# Altium project Industrial_Gateway_Academic.PrjPcb
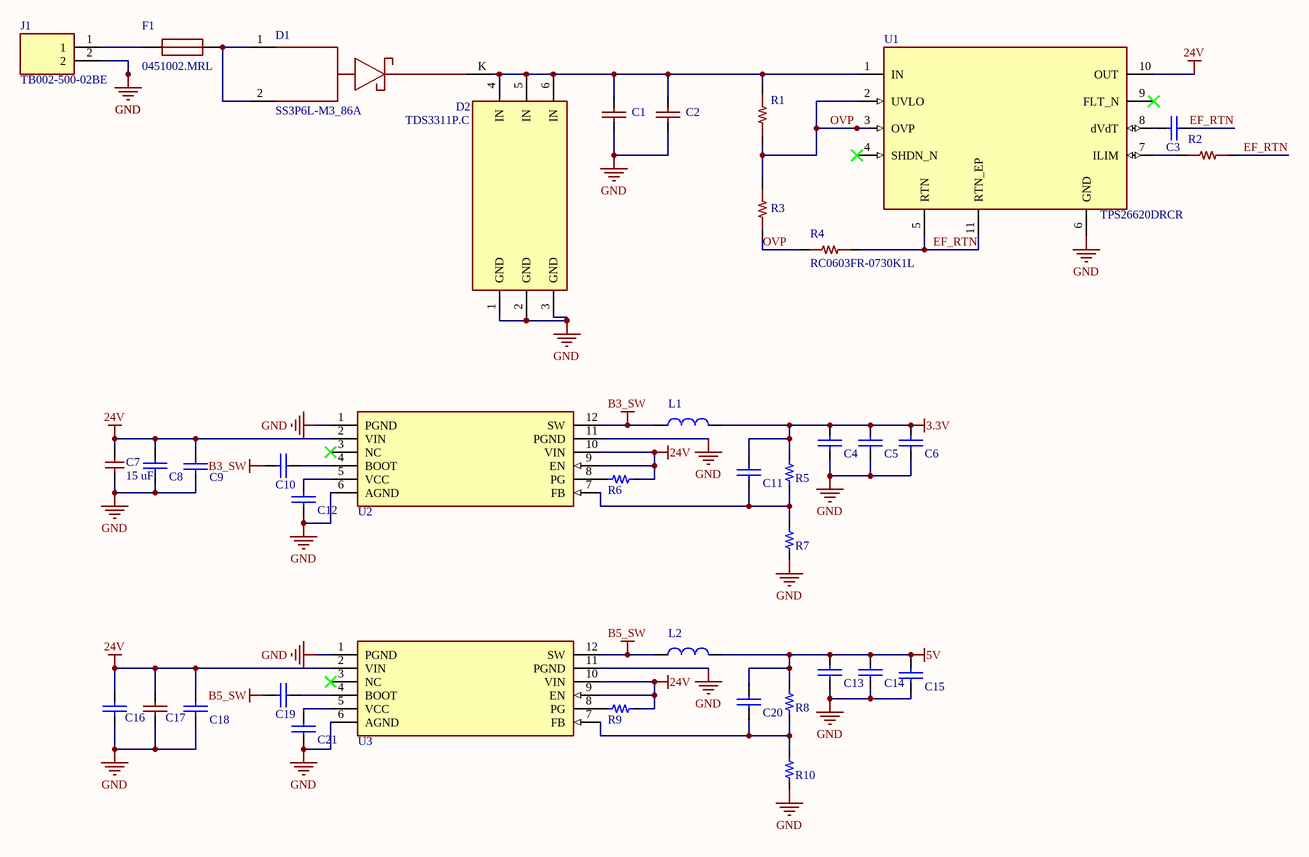
[diagram p0: Power.SchDoc]
5 sheets, 108 parts. Net scope: flat (ports and power ports of the same name join across sheets).
Board file: PCB1.PcbDoc
Sheets:
  Power.SchDoc
  MCU.SchDoc
  Ethernet.SchDoc
  TopLevel.SchDoc
  Field_IO.SchDoc

## Sheet Power.SchDoc
size A3

### Parts
C1  C0805C224K1RACTU  [GW_0805_KEMET_NOMINAL]  (value not drawn)
C2  C5750X7R2A475K230KA  [GW_C5750_TDK_REFLOW]  (value not drawn)
C3  10 nF  [GW_CAND_0603_cap]  (value not drawn)
C4  15 uF por unidad; 45 uF nominal banco  (value not drawn)
C5  15 uF por unidad; 45 uF nominal banco  (value not drawn)
C6  15 uF por unidad; 45 uF nominal banco  (value not drawn)
C7  value 15 uF  (hidden comment: CC2220X7S100V156MN)
C8  220 nF  [GW_CAND_0805_cap]  (value not drawn)
C9  220 nF  [GW_CAND_0805_cap]  (value not drawn)
C10  100 nF  [GW_CAND_0603_cap]  (value not drawn)
C11  20 pF  [GW_CAND_0603_cap]  (value not drawn)
C12  1 uF  [GW_CAND_0603_cap]  (value not drawn)
C13  15 uF por unidad; 45 uF nominal banco  (value not drawn)
C14  15 uF por unidad; 45 uF nominal banco  (value not drawn)
C15  15 uF por unidad; 45 uF nominal banco  (value not drawn)
C16  4.7 uF  [GW_CAND_0805_cap]  (value not drawn)
C17  C0805C224K1RACTU  [GW_0805_KEMET_NOMINAL]  (value not drawn)
C18  220 nF  [GW_CAND_0805_cap]  (value not drawn)
C19  100 nF  [GW_CAND_0603_cap]  (value not drawn)
C20  20 pF  [GW_CAND_0603_cap]  (value not drawn)
C21  1 uF  [GW_CAND_0603_cap]  (value not drawn)
D1  SS3P6L-M3_86A  [GW_SS3P6L_VISHAY_88987]
D2  TDS3311P.C  [GW_TDS3311P_SEMTECH]
F1  0451002.MRL
J1  TB002-500-02BE  [CUI_TB002-500-02BE]
L1  6.8 uH  (value not drawn)
L2  10 uH  (value not drawn)
R1  RC0603FR-07768KL  [GW_RC0603_YAGEO_REFLOW]  (value not drawn)
R2  RC0603FR-0713K3L  [GW_RC0603_YAGEO_REFLOW]  (value not drawn)
R3  RC0603FR-0733K2L  [GW_RC0603_YAGEO_REFLOW]  (value not drawn)
R4  RC0603FR-0730K1L  [GW_RC0603_YAGEO_REFLOW]
R5  100 kOhm  [GW_CAND_0603_res]  (value not drawn)
R6  100 kOhm  [GW_CAND_0603_res]  (value not drawn)
R7  43.2 kOhm  [GW_CAND_0603_res]  (value not drawn)
R8  100 kOhm  [GW_CAND_0603_res]  (value not drawn)
R9  100 kOhm  [GW_CAND_0603_res]  (value not drawn)
R10  24.9 kOhm  [GW_CAND_0603_res]  (value not drawn)
U1  TPS26620DRCR  [GW_DRC0010J_TI_TPS2662]
U2  LMR36015FBRNXR  [GW_RNX0012A_TI]  (value not drawn)
U3  LMR36015FBRNXR  [GW_RNX0012A_TI]  (value not drawn)

### Nets
3.3V: C4.1 C5.1 C6.1 C11.1 L1.2 R5.2
5V: C13.1 C14.1 C15.1 C20.1 L2.2 R8.2
24V: C7.2 C8.1 C9.1 C16.1 C17.2 C18.1 R6.1 R9.1 U1.10(OUT) U2.2(VIN) U2.9(EN) U2.10(VIN) U3.2(VIN) U3.9(EN) U3.10(VIN)
B3_SW: C10.1 L1.1 U2.12(SW)
B5_SW: C19.1 L2.1 U3.12(SW)
GND: C1.1 C2.1 C4.2 C5.2 C6.2 C7.1 C8.2 C9.2 C12.2 C13.2 C14.2 C15.2 C16.2 C17.1 C18.2 C21.2 D2.1(GND) D2.2(GND) D2.3(GND) J1.2 R7.1 R10.1 U1.6(GND) U2.1(PGND) U2.6(AGND) U2.11(PGND) U3.1(PGND) U3.6(AGND) U3.11(PGND)
EF_RTN: C3.1 R2.2 R4.2 U1.5(RTN) U1.11(RTN_EP)
OVP: R1.1 R3.1 R3.2 R4.1 U1.2(UVLO) U1.3(OVP)
NetC1_2: C1.2 C2.2 D1.K(CATHODE) D2.4(IN) D2.5(IN) D2.6(IN) R1.2 U1.1(IN)
NetC3_2: C3.2 U1.8(dVdT)
NetC10_2: C10.2 U2.4(BOOT)
NetC11_2: C11.2 R5.1 R7.2 U2.7(FB)
NetC12_1: C12.1 U2.5(VCC)
NetC19_2: C19.2 U3.4(BOOT)
NetC20_2: C20.2 R8.1 R10.2 U3.7(FB)
NetC21_1: C21.1 U3.5(VCC)
NetD1_1: D1.1(ANODE1) D1.2(ANODE2) F1.2(END2)
NetF1_1: F1.1(END1) J1.1
NetR2_1: R2.1 U1.7(ILIM)
NetR6_2: R6.2 U2.8(PG)
NetR9_2: R9.2 U3.8(PG)

Not connected (* = marked no-connect by the designer): U1 4(SHDN_N)* 9(FLT_N)*; U2 3(NC)*; U3 3(NC)*

### Library data of the parts
C1 C17 = C0805C224K1RACTU: KEMET exact0805 spec body/termination dimensions; KEMET C1027 p12 Table3 nominal2012 reflow lands transferred to mechanically matching commercial0805; 220nF10%100VX7R;; Design Approval: PROTOTYPE_APPROVED; Electrical Test: NOT_TESTED; CAD Status: CAD_VERIFIED; Limitations: None; Manufacturer: KEMET; Manufacturer Part Number: C0805C224K1RACTU; Value: 220nF10%100VX7R; Source: KEMET exact0805 spec body/termination dimensions; KEMET C1027 p12 Table3 nominal2012 reflow lands transferred to mechanically matching commercial0805
C2 = C5750X7R2A475K230KA: TDK C5750X7R2A475K230KA exact2014web-derived PDF p1 lands,p2 DCbias; current official product page same PA/PB/PC; 4.7uF10%100VX7R;; Design Approval: PROTOTYPE_APPROVED; Electrical Test: NOT_TESTED; CAD Status: CAD_VERIFIED; Limitations: None; Manufacturer: TDK; Manufacturer Part Number: C5750X7R2A475K230KA; Value: 4.7uF10%100VX7R; Source: TDK C5750X7R2A475K230KA exact2014web-derived PDF p1 lands,p2 DCbias; current official product page same PA/PB/PC
C3 = GW_C0603C103K1RACTU_97f3ee33: C0603C103K1RACTU; 10 nF; 100 V; X7R; -55..125 C; CAD_CANDIDATE; Manufacturer: KEMET; Tolerance: 10%; Electrical_Status: PROVISIONAL; CAD_Source: Professor_shared.SchLib glyph Cap_0.1uF_0603_50V; CAD_Limitations: Glyph pins/types inspected; exact manufacturer land-pattern/mask/paste qualification pending.; Electrical_Notes: Ficha KEMET local DI_CIN p1; no confundir con externo CL10B103KA8WPNC 25 V. Modelo candidato existente; sin cotejo visual de pads/pines en Altium.; Manufacturer Part Number: C0603C103K1RACTU; Value: 10 nF; Rating: 100 V; X7R; -55..125 C; Power Rating: N/A; Package: 0603; CAD_Status: CAD_CANDIDATE
C4-C6 C13-C15 = GW_C3225X7R1C156M250AB_bb412b42: C3225X7R1C156M250AB; 15 uF por unidad; 45 uF nominal banco; 16 V; X7R; CAD_CANDIDATE; Manufacturer: TDK; Tolerance: 20%; CAD_Status: CAD_BLOCKED; Electrical_Status: PROVISIONAL; CAD_Source: Professor_shared.SchLib glyph Cap_0.1uF_0603_50V; CAD_Limitations: Symbol only. Exact manufacturer land pattern absent locally; footprint blocked. Ratings copied from provisional BOM, not newly approved.; Electrical_Notes: Ceff a 3.3 V, ESR, escalon de carga y Bode pendientes. No atribuir 45 uF efectivos ni ESR3.04mOhm del modelo AR. Sin footprint1210 docente.; Manufacturer Part Number: C3225X7R1C156M250AB; Value: 15 uF por unidad; 45 uF nominal banco; Rating: 16 V; X7R; Power Rating: N/A; Package: 1210
C7 = CC2220X7S100V156MN: TORCH15uF100V2220 MLCC; C54157533 catalog identity; family PDF does not explicitly cover X7S. Footprint pending exact manufacturer lands.; Manufacturer: TORCH; Tolerance: 20% (M ordering code); Voltage Rating: 100 V; Dielectric: X7S per MPN; not explicitly covered in supplied family PDF; CAD Status: SYMBOL_READY;FOOTPRINT_MISSING; Electrical Status: PROVISIONAL;NOT_SELECTED_AS_BOM_REPLACEMENT; Limitations: Family PDF p1 codes156/M/100V and2220body; X7S exact specifications, DCbias/effective capacitance and manufacturer lands unverified. No application approval.; Manufacturer Part Number: CC2220X7S100V156MN; Package: 2220; LCSC: C54157533; Datasheet: sources/cap15uf100v/C54157533.pdf; Catalog URL: https://www.lcsc.com/product-detail/C54157533.html
C8 C9 C18 = GW_C0805C224K1RACTU_e16e52b8: C0805C224K1RACTU; 220 nF; 100 V; X7R; CAD_CANDIDATE; Manufacturer: KEMET; Tolerance: 10%; Electrical_Status: PROVISIONAL; CAD_Source: Professor_shared.SchLib glyph Cap_10uF_0805_25V_; CAD_Limitations: Glyph pins/types inspected; exact manufacturer land-pattern/mask/paste qualification pending.; Electrical_Notes: Uno por par VIN-PGND en lados opuestos; falta Ceff y cotejo dimensiones pads. Modelo candidato existente; sin cotejo visual de pads/pines en Altium.; Manufacturer Part Number: C0805C224K1RACTU; Value: 220 nF; Rating: 100 V; X7R; Power Rating: N/A; Package: 0805; CAD_Status: CAD_CANDIDATE
C10 C19 = GW_C0603C104K5RACTU_dc5e12a5: C0603C104K5RACTU; 100 nF; 50 V; X7R; -55..125 C; CAD_CANDIDATE; Manufacturer: KEMET; Tolerance: 10%; Electrical_Status: PROVISIONAL; CAD_Source: Professor_shared.SchLib glyph Cap_0.1uF_0603_50V; CAD_Limitations: Glyph pins/types inspected; exact manufacturer land-pattern/mask/paste qualification pending.; Electrical_Notes: Ficha KEMET local p1. Adaptar parametros; no usar el Y5V 0603F104Z500CT como equivalente. Modelo candidato existente; sin cotejo visual de pads/pines en Altium.; Manufacturer Part Number: C0603C104K5RACTU; Value: 100 nF; Rating: 50 V; X7R; -55..125 C; Power Rating: N/A; Package: 0603; CAD_Status: CAD_CANDIDATE
C11 C20 = GW_C0603C200J5GACTU_c75b007a: C0603C200J5GACTU; 20 pF; 50 V; C0G; CAD_CANDIDATE; Manufacturer: KEMET; Tolerance: 5%; Electrical_Status: PROVISIONAL; CAD_Source: Professor_shared.SchLib glyph Cap_0.1uF_0603_50V; CAD_Limitations: Glyph pins/types inspected; exact manufacturer land-pattern/mask/paste qualification pending.; Electrical_Notes: Valor guia fabricante; validar lazo. Con RFBT100k no obligatorio universal; reservar DNP hasta respuesta/Bode. Modelo candidato existente; sin cotejo visual de pads/pines en Altium.; Manufacturer Part Number: C0603C200J5GACTU; Value: 20 pF; Rating: 50 V; C0G; Power Rating: N/A; Package: 0603; CAD_Status: CAD_CANDIDATE
C12 C21 = GW_CL10A105KB8NNNC_c3932faa: CL10A105KB8NNNC; 1 uF; 50 V; X5R; -55..85 C; CAD_CANDIDATE; Manufacturer: Samsung Electro-Mechanics; Tolerance: 10%; Electrical_Status: PROVISIONAL; CAD_Source: Professor_shared.SchLib glyph Cap_1uF_0603_50V; CAD_Limitations: Glyph pins/types inspected; exact manufacturer land-pattern/mask/paste qualification pending.; Electrical_Notes: Samsung ficha oficial; Ceff/ESR pendientes por aplicacion. Limite X5R 85 C: no homologado para ambiente superior. Modelo candidato existente; sin cotejo visual de pads/pines en Altium.; Manufacturer Part Number: CL10A105KB8NNNC; Value: 1 uF; Rating: 50 V; X5R; -55..85 C; Power Rating: N/A; Package: 0603; CAD_Status: CAD_CANDIDATE
C16 = GW_C0805C475K4RACTU_82374e08: C0805C475K4RACTU; 4.7 uF; 16 V; X7R; CAD_CANDIDATE; Manufacturer: KEMET; Tolerance: 10%; Electrical_Status: PROVISIONAL; CAD_Source: Professor_shared.SchLib glyph Cap_10uF_0805_25V_; CAD_Limitations: Glyph pins/types inspected; exact manufacturer land-pattern/mask/paste qualification pending.; Electrical_Notes: Ceff a 3.3 V pendiente; no sustituir por 10 uF solo por disponibilidad. Modelo candidato existente; sin cotejo visual de pads/pines en Altium.; Manufacturer Part Number: C0805C475K4RACTU; Value: 4.7 uF; Rating: 16 V; X7R; Power Rating: N/A; Package: 0805; CAD_Status: CAD_CANDIDATE
D1 = SS3P6L-M3_86A: User-approved series reverse diode:manufacturer1/2 anodes,K large cathode. Same model also reserved DNP output clamp; do not populateSOUT withoutVF review. No hot reverse while charged.; Manufacturer: Vishay; Manufacturer Part Number: SS3P6L-M3/86A; CAD Status: CAD_VERIFIED; Electrical Approval: PROTOTYPE_APPROVED; Electrical Test: NOT_TESTED; Source: Vishay88987 Rev24-Apr-2020 pp1,4; numbered anodes1/2, cathodeK; minimum mounting lands; Datasheet: sources/SS3P6L_88987.pdf; Limitations: User-approved series reverse diode:manufacturer1/2 anodes,K large cathode. Same model also reserved DNP output clamp; do not populateSOUT withoutVF review. No hot reverse while charged.; Design Approval: PROTOTYPE_APPROVED
D2 = TDS3311P.C: Semtech TDS3311P Rev2.4 pp2,7-9; official product portal confirms33V orderTDS3311P.C; 33V working;42Vmax specified35A pulse;; Design Approval: PROTOTYPE_APPROVED; Electrical Test: NOT_TESTED; CAD Status: CAD_VERIFIED; Limitations: None; Manufacturer: Semtech; Manufacturer Part Number: TDS3311P.C; Value: 33V working;42Vmax specified35A pulse; Source: Semtech TDS3311P Rev2.4 pp2,7-9; official product portal confirms33V orderTDS3311P.C
F1 = 0451002.MRL: User-approved2A125VDC fuse; manufacturer dimensioned native footprint linked. Nonpolar terminals project1/2; supervised current-limited lab source. Not electrically tested.; Manufacturer: Littelfuse; CAD Status: CAD_VERIFIED; Electrical Approval: PROTOTYPE_APPROVED; Electrical Test: NOT_TESTED; Manufacturer Part Number: 0451002.MRL; Source: Official451/453 series Rev01-Dec-2025 pp1-4; electrical row002 and ordering; Datasheet: https://www.littelfuse.com/assetdocs/fuse-451-and-453-datasheet?assetguid=533cd5cc-956c-4243-867f-6ab5a62f6ba1; Limitations: User-approved2A125VDC fuse; manufacturer dimensioned native footprint linked. Nonpolar terminals project1/2; supervised current-limited lab source. Not electrically tested.; Design Approval: PROTOTYPE_APPROVED
J1 = TB002-500-02BE: 2~24 Poles, Screw Type, Horizontal, 5.0 Pitch, 22~12 (AWG), Terminal Block Connector; Manufacturer: Same Sky (Formerly CUI Devices); MF: Same Sky; SnapEDA_Link: https://www.snapeda.com/parts/TB002-500-02BE/Same+Sky/view-part/?ref=snap; Package: None; Value: *; MP: TB002-500-02BE; Check_prices: https://www.snapeda.com/parts/TB002-500-02BE/Same+Sky/view-part/?ref=eda; Manufacturer Part Number: TB002-500-02BE
L1 = GW_XAL4030-682MEC_71dfd711: XAL4030-682MEC; 6.8 uH; Isat25C 3.6 A; Irms20C 3.0 A; CAD_CANDIDATE; Manufacturer: Coilcraft; Tolerance: 20%; CAD_Status: CAD_BLOCKED; Electrical_Status: PROVISIONAL; CAD_Source: Professor_shared.SchLib glyph Inductor_10uH_4A_7.2*6.6mm; CAD_Limitations: Symbol only. Exact manufacturer land pattern absent locally; footprint blocked. Ratings copied from provisional BOM, not newly approved.; Electrical_Notes: DCRmax25C 74.1 mOhm. Isat es caida30% tipica; falta derating caliente/curva L(I)/perdidas nucleo y CAD. No usar inductor docente sin Isat verificable.; Manufacturer Part Number: XAL4030-682MEC; Value: 6.8 uH; Rating: Isat25C 3.6 A; Irms20C 3.0 A; Power Rating: N/A; Package: XAL4030
L2 = GW_XAL4040-103MEC_b36cb917: XAL4040-103MEC; 10 uH; Isat25C 3.0 A; Irms20C 2.2 A; CAD_CANDIDATE; Manufacturer: Coilcraft; Tolerance: 20%; CAD_Status: CAD_BLOCKED; Electrical_Status: PROVISIONAL; CAD_Source: Professor_shared.SchLib glyph Inductor_10uH_4A_7.2*6.6mm; CAD_Limitations: Symbol only. Exact manufacturer land pattern absent locally; footprint blocked. Ratings copied from provisional BOM, not newly approved.; Electrical_Notes: DCRmax25C 92.4 mOhm. Isat es caida30% tipica; falta derating caliente/curva L(I)/perdidas nucleo y CAD. No usar inductor docente sin Isat verificable.; Manufacturer Part Number: XAL4040-103MEC; Value: 10 uH; Rating: Isat25C 3.0 A; Irms20C 2.2 A; Power Rating: N/A; Package: XAL4040
R1 = RC0603FR-07768KL: 768kOhm1%0.1W75V; Exact Yageo spec; manufacturer Mounting2018p4Fig4/Table1; Design Approval: PROPOSED_APPLICATION_VALUE; CAD Status: CAD_VERIFIED; Electrical Test: NOT_TESTED; Manufacturer: Yageo; Manufacturer Part Number: RC0603FR-07768KL; Value: 768kOhm1%0.1W75V; Source: Exact Yageo spec; manufacturer Mounting2018p4Fig4/Table1; Datasheet: https://yageogroup.com/download/specsheet/RC0603FR-07768KL
R2 = RC0603FR-0713K3L: 13.3kOhm1%0.1W75V; Exact Yageo spec; manufacturer Mounting2018p4Fig4/Table1; Design Approval: PROPOSED_APPLICATION_VALUE; CAD Status: CAD_VERIFIED; Electrical Test: NOT_TESTED; Manufacturer: Yageo; Manufacturer Part Number: RC0603FR-0713K3L; Value: 13.3kOhm1%0.1W75V; Source: Exact Yageo spec; manufacturer Mounting2018p4Fig4/Table1; Datasheet: https://yageogroup.com/download/specsheet/RC0603FR-0713K3L
R3 = RC0603FR-0733K2L: 33.2kOhm1%0.1W75V; Exact Yageo spec; manufacturer Mounting2018p4Fig4/Table1; Design Approval: PROPOSED_APPLICATION_VALUE; CAD Status: CAD_VERIFIED; Electrical Test: NOT_TESTED; Manufacturer: Yageo; Manufacturer Part Number: RC0603FR-0733K2L; Value: 33.2kOhm1%0.1W75V; Source: Exact Yageo spec; manufacturer Mounting2018p4Fig4/Table1; Datasheet: https://yageogroup.com/download/specsheet/RC0603FR-0733K2L
R4 = RC0603FR-0730K1L: 30.1kOhm1%0.1W75V; Exact Yageo spec; manufacturer Mounting2018p4Fig4/Table1; Design Approval: PROPOSED_APPLICATION_VALUE; CAD Status: CAD_VERIFIED; Electrical Test: NOT_TESTED; Manufacturer: Yageo; Manufacturer Part Number: RC0603FR-0730K1L; Value: 30.1kOhm1%0.1W75V; Source: Exact Yageo spec; manufacturer Mounting2018p4Fig4/Table1; Datasheet: https://yageogroup.com/download/specsheet/RC0603FR-0730K1L
R5 R6 R8 R9 = GW_RC0603FR-07100KL_ac663db8: RC0603FR-07100KL; 100 kOhm; 75 V max; limite sqrt(P*R); CAD_CANDIDATE; Manufacturer: Yageo; Tolerance: 1%; Power Rating: 0.1 W @70 C; Electrical_Status: PROVISIONAL; CAD_Source: Professor_shared.SchLib glyph Res_10k_0603_1/10W; CAD_Limitations: Glyph pins/types inspected; exact manufacturer land-pattern/mask/paste qualification pending.; Electrical_Notes: Vout nominal calculado 3.31481 V; ver esquinas de tolerancia. Cambiar parametros en copia docente. Modelo candidato existente; sin cotejo visual de pads/pines en Altium.; Manufacturer Part Number: RC0603FR-07100KL; Value: 100 kOhm; Rating: 75 V max; limite sqrt(P*R); Package: 0603; CAD_Status: CAD_CANDIDATE
R7 = GW_RC0603FR-0743K2L_a8308c0c: RC0603FR-0743K2L; 43.2 kOhm; 75 V max; limite sqrt(P*R); CAD_CANDIDATE; Manufacturer: Yageo; Tolerance: 1%; Power Rating: 0.1 W @70 C; Electrical_Status: PROVISIONAL; CAD_Source: Professor_shared.SchLib glyph Res_10k_0603_1/10W; CAD_Limitations: Glyph pins/types inspected; exact manufacturer land-pattern/mask/paste qualification pending.; Electrical_Notes: Vout nominal calculado 3.31481 V; ver esquinas de tolerancia. Cambiar parametros en copia docente. Modelo candidato existente; sin cotejo visual de pads/pines en Altium.; Manufacturer Part Number: RC0603FR-0743K2L; Value: 43.2 kOhm; Rating: 75 V max; limite sqrt(P*R); Package: 0603; CAD_Status: CAD_CANDIDATE
R10 = GW_RC0603FR-0724K9L_10698e9e: RC0603FR-0724K9L; 24.9 kOhm; 75 V max; limite sqrt(P*R); CAD_CANDIDATE; Manufacturer: Yageo; Tolerance: 1%; Power Rating: 0.1 W @70 C; Electrical_Status: PROVISIONAL; CAD_Source: Professor_shared.SchLib glyph Res_10k_0603_1/10W; CAD_Limitations: Glyph pins/types inspected; exact manufacturer land-pattern/mask/paste qualification pending.; Electrical_Notes: Vout nominal calculado 5.01606 V; ver esquinas de tolerancia. Cambiar parametros en copia docente. Modelo candidato existente; sin cotejo visual de pads/pines en Altium.; Manufacturer Part Number: RC0603FR-0724K9L; Value: 24.9 kOhm; Rating: 75 V max; limite sqrt(P*R); Package: 0603; CAD_Status: CAD_CANDIDATE
U1 = TPS26620DRCR: Single-channel60V eFuse; TPS26620 latch-off; RTN != system GND; DRC10+EP11; Manufacturer: Texas Instruments; Local Datasheet: sources/tps26620/tps2662.pdf; CAD Status: CAD_CANDIDATE; Design Approval: APPROVED_COMPONENT_SELECTION; Electrical Test: NOT_TESTED; Critical Connection: Pin5 and EP11 to EF_RTN, NEVER directly to system GND pin6; Fault Response: TPS26620 latch-off, adjustable overvoltage cutoff; not TPS26621 auto-retry; Manufacturer Part Number: TPS26620DRCR; Datasheet: https://www.ti.com/lit/ds/symlink/tps2662.pdf; Source: TI TPS2662 SLVSDT4F Dec2021 Table6-1 p4; DRC0010J4218878/B board p44/stencil p45; Footprint Limitation: Native custom-pad11 extension conversion/net inheritance pending; not PCB-release ready
U2 U3 = LMR36015FBRNXR: LMR36015FBRNXR; CAD_CANDIDATE; CAD_CANDIDATE: confirm delivered RNX revision A/B. NC3 is externally connected to SW per TI. RNX12 is SW, not a ground exposed pad. Two footprint variants retained.; Manufacturer: Texas Instruments; Electrical_Status: PROVISIONAL; CAD_Source: SNVSB49D p4; RNX0012A 4222858/A PDF pp44-46 and RNX0012B 4223969/C pp47-49; Manufacturer Part Number: LMR36015FBRNXR; Value: LMR36015FBRNXR; CAD_Status: CAD_CANDIDATE; CAD_Limitations: CAD_CANDIDATE: confirm delivered RNX revision A/B. NC3 is externally connected to SW per TI. RNX12 is SW, not a ground exposed pad. Two footprint variants retained.

## Sheet MCU.SchDoc
size A4
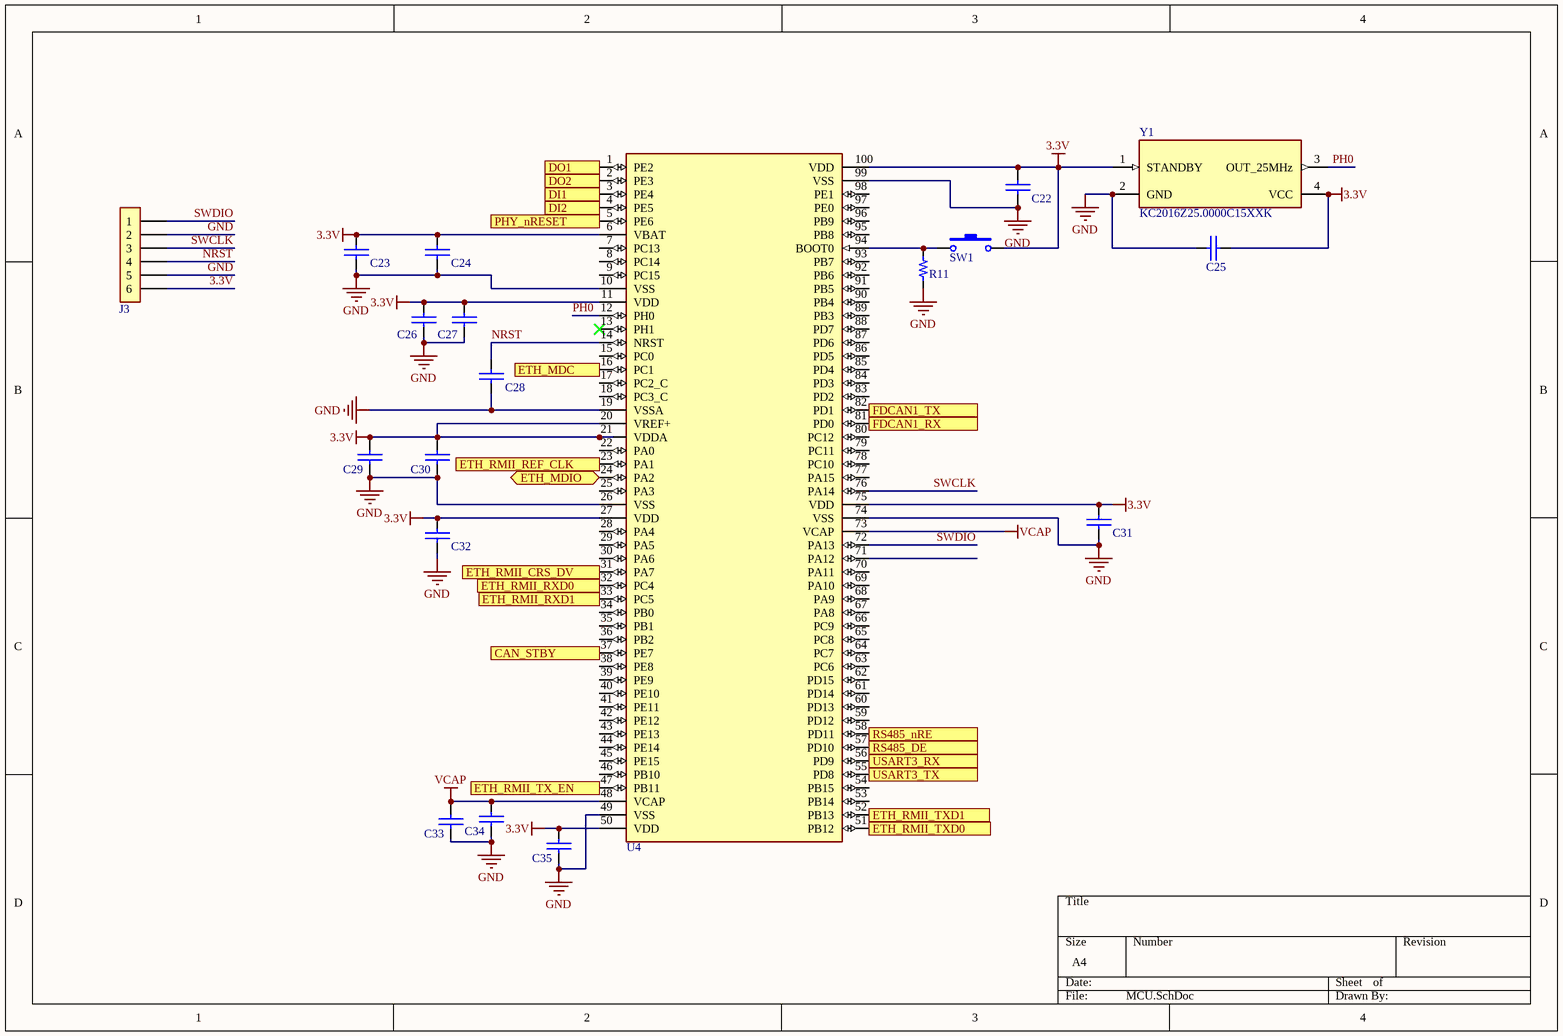
[diagram p1: MCU.SchDoc]

### Parts
C22  100 nF  [GW_CAND_0603_cap]  (value not drawn)
C23  1 uF  [GW_CAND_0603_cap]  (value not drawn)
C24  100 nF  [GW_CAND_0603_cap]  (value not drawn)
C25  10 nF  [GW_CAND_0603_cap]  (value not drawn)
C26  100 nF  [GW_CAND_0603_cap]  (value not drawn)
C27  4.7 uF  [GW_CAND_0805_cap]  (value not drawn)
C28  100 nF  [GW_CAND_0603_cap]  (value not drawn)
C29  1 uF  [GW_CAND_0603_cap]  (value not drawn)
C30  100 nF  [GW_CAND_0603_cap]  (value not drawn)
C31  100 nF  [GW_CAND_0603_cap]  (value not drawn)
C32  100 nF  [GW_CAND_0603_cap]  (value not drawn)
C33  2.2 uF  [GW_CAND_0603_cap]  (value not drawn)
C34  2.2 uF  [GW_CAND_0603_cap]  (value not drawn)
C35  100 nF  [GW_CAND_0603_cap]  (value not drawn)
J3  6 posiciones  [GW_CAND_H_6x1_TH_100mil]  (value not drawn)
R11  10 kOhm  [GW_CAND_0603_res]  (value not drawn)
SW1  SPST-NO  (value not drawn)
U4  STM32H723VET6  [GW_LQFP100_ST_1L]  (value not drawn)
Y1  KC2016Z25.0000C15XXK  [GW_KC2016Z_KYOCERA]

### Ports
CAN_STBY (out), DI1 (in), DI2 (in), DO1 (in), DO2 (in), ETH_MDC (out), ETH_MDIO (bidir), ETH_RMII_CRS_DV (in), ETH_RMII_REF_CLK (in), ETH_RMII_RXD0 (in), ETH_RMII_RXD1 (in), ETH_RMII_TX_EN (out), ETH_RMII_TXD0 (out), ETH_RMII_TXD1 (out), FDCAN1_RX (in), FDCAN1_TX (out), PHY_nRESET (out), RS485_DE (out), RS485_nRE (out), USART3_RX (in), USART3_TX (out)

### Nets
3.3V: C22.1 C23.1 C24.1 C25.2 C26.1 C27.1 C29.1 C31.1 C32.1 C35.1 J3.6 SW1.2 U4.6(VBAT) U4.11(VDD) U4.20(VREF+) U4.21(VDDA) U4.27(VDD) U4.50(VDD) U4.75(VDD) U4.100(VDD) Y1.1(STANDBY) Y1.4(VCC)
GND: C22.2 C23.2 C24.2 C25.1 C26.2 C27.2 C28.2 C29.2 C30.2 C31.2 C32.2 C33.2 C34.2 C35.2 J3.2 J3.5 R11.2 U4.10(VSS) U4.19(VSSA) U4.26(VSS) U4.49(VSS) U4.74(VSS) U4.99(VSS) Y1.2(GND)
VCAP: C33.1 C34.1 U4.48(VCAP) U4.73(VCAP)
NRST: C28.1 J3.4 U4.14(NRST)
PH0: U4.12(PH0) Y1.3(OUT_25MHz)
SWCLK: J3.3 U4.76(PA14)
SWDIO: J3.1 U4.72(PA13)
NetR11_1: R11.1 SW1.1 U4.94(BOOT0)
NetR16_1: U4.58(PD11) ; port RS485_nRE
NetR18_2: U4.57(PD10) ; port RS485_DE
NetR21_2: U4.3(PE4) ; port DI1
NetR22_2: U4.4(PE5) ; port DI2
NetR24_2: U4.1(PE2) ; port DO1
NetR25_2: U4.2(PE3) ; port DO2
NetU4_5: U4.5(PE6) ; port PHY_nRESET
NetU4_16: U4.16(PC1) ; port ETH_MDC
NetU4_23: U4.23(PA1) ; port ETH_RMII_REF_CLK
NetU4_24: U4.24(PA2) ; port ETH_MDIO
NetU4_31: U4.31(PA7) ; port ETH_RMII_CRS_DV
NetU4_32: U4.32(PC4) ; port ETH_RMII_RXD0
NetU4_33: U4.33(PC5) ; port ETH_RMII_RXD1
NetU4_37: U4.37(PE7) ; port CAN_STBY
NetU4_47: U4.47(PB11) ; port ETH_RMII_TX_EN
NetU4_51: U4.51(PB12) ; port ETH_RMII_TXD0
NetU4_52: U4.52(PB13) ; port ETH_RMII_TXD1
NetU4_55: U4.55(PD8) ; port USART3_TX
NetU4_56: U4.56(PD9) ; port USART3_RX
NetU4_81: U4.81(PD0) ; port FDCAN1_RX
NetU4_82: U4.82(PD1) ; port FDCAN1_TX

Not connected (* = marked no-connect by the designer): C30 1; U4 7(PC13) 8(PC14) 9(PC15) 13(PH1)* 15(PC0) 17(PC2_C) 18(PC3_C) 22(PA0) 25(PA3) 28(PA4) 29(PA5) 30(PA6) 34(PB0) 35(PB1) 36(PB2) 38(PE8) 39(PE9) 40(PE10) 41(PE11) 42(PE12) 43(PE13) 44(PE14) 45(PE15) 46(PB10) 53(PB14) 54(PB15) 59(PD12) 60(PD13) 61(PD14) 62(PD15) 63(PC6) 64(PC7) 65(PC8) 66(PC9) 67(PA8) 68(PA9) 69(PA10) 70(PA11) 71(PA12) 77(PA15) 78(PC10) 79(PC11) 80(PC12) 83(PD2) 84(PD3) 85(PD4) 86(PD5) 87(PD6) 88(PD7) 89(PB3) 90(PB4) 91(PB5) 92(PB6) 93(PB7) 95(PB8) 96(PB9) 97(PE0) 98(PE1)

### Library data of the parts
C22 C24 C26 C28 C30-C32 C35 = GW_C0603C104K5RACTU_dc5e12a5: as C10 on sheet Power; Manufacturer Part Number: C0603C104K5RACTU; Value: 100 nF; Rating: 50 V; X7R; -55..125 C; Power Rating: N/A; Package: 0603; CAD_Status: CAD_CANDIDATE
C23 C29 = GW_CL10A105KB8NNNC_c3932faa: as C12 on sheet Power; Manufacturer Part Number: CL10A105KB8NNNC; Value: 1 uF; Rating: 50 V; X5R; -55..85 C; Power Rating: N/A; Package: 0603; CAD_Status: CAD_CANDIDATE
C25 = GW_C0603C103K1RACTU_97f3ee33: as C3 on sheet Power; Manufacturer Part Number: C0603C103K1RACTU; Value: 10 nF; Rating: 100 V; X7R; -55..125 C; Power Rating: N/A; Package: 0603; CAD_Status: CAD_CANDIDATE
C27 = GW_C0805C475K4RACTU_82374e08: as C16 on sheet Power; Manufacturer Part Number: C0805C475K4RACTU; Value: 4.7 uF; Rating: 16 V; X7R; Power Rating: N/A; Package: 0805; CAD_Status: CAD_CANDIDATE
C33 C34 = GW_C0603C225K8RACTU_46503424: C0603C225K8RACTU; 2.2 uF; 10 V; X7R; ESR <100 mOhm; CAD_CANDIDATE; Manufacturer: KEMET; Tolerance: 10% candidato; ST permite 20%; Electrical_Status: PROVISIONAL; CAD_Source: Professor_shared.SchLib glyph Cap_0.1uF_0603_50V; CAD_Limitations: Glyph pins/types inspected; exact manufacturer land-pattern/mask/paste qualification pending.; Electrical_Notes: Falta ESR y capacitancia bajo VCORE/temperatura/envejecimiento. No conectar 3.3 V ni carga externa a VCAP. Modelo candidato existente; sin cotejo visual de pads/pines en Altium.; Manufacturer Part Number: C0603C225K8RACTU; Value: 2.2 uF; Rating: 10 V; X7R; ESR <100 mOhm; Power Rating: N/A; Package: 0603; CAD_Status: CAD_CANDIDATE
J3 = GW_H_Male_6x1_TH_100mil_c0450d1e: TBD; 6 posiciones; TBD; CAD_CANDIDATE; Manufacturer: UNVERIFIED; see original candidate BOM; Electrical_Status: PROVISIONAL; CAD_Source: Professor_shared.SchLib glyph H_Male_6x1_TH_100mil; CAD_Limitations: Glyph pins/types inspected; exact manufacturer land-pattern/mask/paste qualification pending.; Electrical_Notes: Pinout, MPN y orientacion pendientes. No alimentar VDD desde VTref; SWD PA13/PA14 y NRST. Modelo candidato existente; sin cotejo visual de pads/pines en Altium.; Manufacturer Part Number: TBD; Value: 6 posiciones; Tolerance: TBD; Rating: TBD; Power Rating: N/A; Package: TBD; CAD_Status: CAD_CANDIDATE
R11 = GW_FRC0603J103TS_7289f91d: FRC0603J103TS; 10 kOhm; >= 3.3 V; tension de trabajo por verificar; CAD_CANDIDATE; Manufacturer: FOJAN; Tolerance: 5%; Power Rating: 0.1 W; Electrical_Status: PROVISIONAL; CAD_Source: Professor_shared.SchLib glyph Res_10k_0603_1/10W; CAD_Limitations: Glyph pins/types inspected; exact manufacturer land-pattern/mask/paste qualification pending.; Electrical_Notes: Ratings transcritos del CAD; falta ficha FOJAN. Alternativa RC0603FR-0710KL con ficha oficial local, mismo footprint candidato. Modelo candidato existente; sin cotejo visual de pads/pines en Altium.; Manufacturer Part Number: FRC0603J103TS; Value: 10 kOhm; Rating: >= 3.3 V; tension de trabajo por verificar; Package: 0603; CAD_Status: CAD_CANDIDATE
SW1 = GW_Sw_PUSH_4.5x4.5x5.0xmm_0f078dd9: TBD; SPST-NO; TBD; CAD_CANDIDATE; Manufacturer: UNVERIFIED; see original candidate BOM; CAD_Status: CAD_BLOCKED; Electrical_Status: PROVISIONAL; CAD_Source: Professor_shared.SchLib glyph Sw_PUSH_4.5x4.5x5.0xmm; CAD_Limitations: Footprint unfinished: paired pads 1/1 and 2/2 in professor source are rejected by official writer duplicate-designator validation. Exact switch MPN/terminal-pairing drawing and native copy verification required. No pad renumbering invented.; Electrical_Notes: Pinout, MPN y orientacion pendientes. No alimentar VDD desde VTref; SWD PA13/PA14 y NRST. Modelo candidato existente; sin cotejo visual de pads/pines en Altium.; Manufacturer Part Number: TBD; Value: SPST-NO; Tolerance: TBD; Rating: TBD; Power Rating: N/A; Package: TBD
U4 = STM32H723VET6: STM32H723VET6; CAD_CANDIDATE; GPIOs use bidirectional ERC type; oscillator pins have dedicated types. VCAP power pins are LDO outputs, never connect to VDD.; Manufacturer: STMicroelectronics; Electrical_Status: PROVISIONAL; CAD_Source: DS13313 Rev5 fig5, table7 pp57-71, fig65 p218 (PDF p219); Manufacturer Part Number: STM32H723VET6; Value: STM32H723VET6; CAD_Status: CAD_CANDIDATE; CAD_Limitations: GPIOs use bidirectional ERC type; oscillator pins have dedicated types. VCAP power pins are LDO outputs, never connect to VDD.
Y1 = KC2016Z25.0000C15XXK: Kyocera TNY1T-H1-DEX01-11 17-Jul-2026 pp4,6 table2 fig4; Two independent oscillators proposed; 10nF per supply. Tie1 to3V3. Load<=15pF and PHY phase-noise qualification pending.; CAD Status: CAD_CANDIDATE; Manufacturer: Kyocera; Manufacturer Part Number: KC2016Z25.0000C15XXK; Source: Kyocera TNY1T-H1-DEX01-11 17-Jul-2026 pp4,6 table2 fig4; Limitations: Two independent oscillators proposed; 10nF per supply. Tie1 to3V3. Load<=15pF and PHY phase-noise qualification pending.

## Sheet Ethernet.SchDoc
size A3
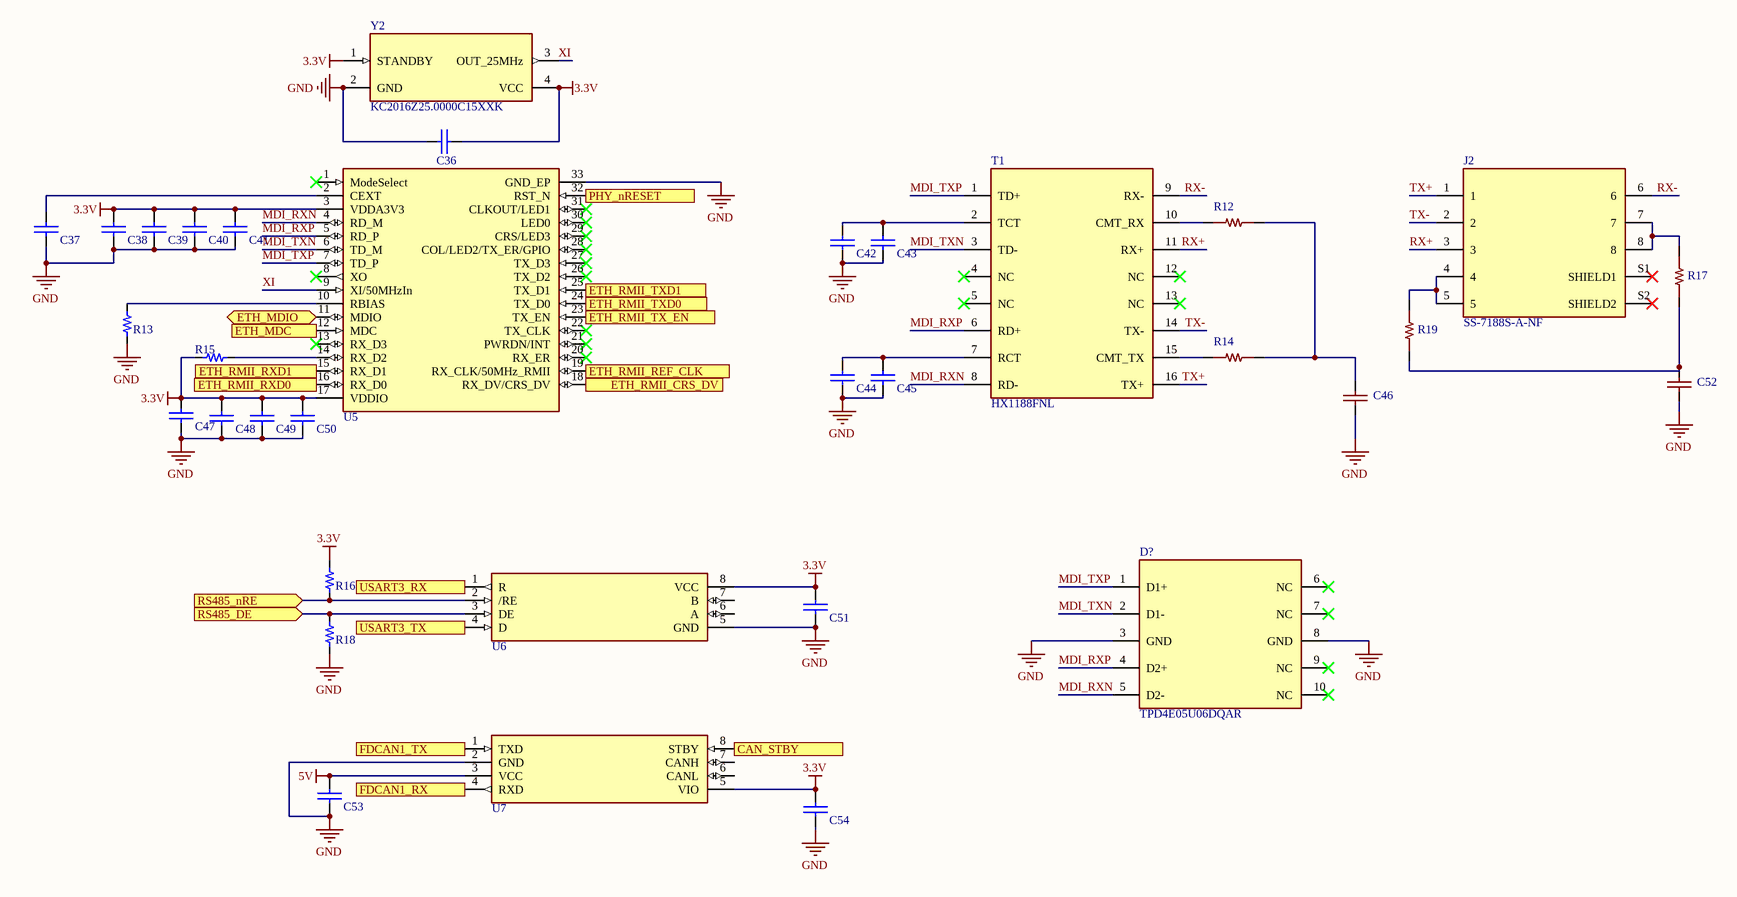
[diagram p2: Ethernet.SchDoc]

### Parts
C36  10 nF  [GW_CAND_0603_cap]  (value not drawn)
C37  2 nF  [GW_CAND_0603_cap]  (value not drawn)
C38  10 nF  [GW_CAND_0603_cap]  (value not drawn)
C39  100 nF  [GW_CAND_0603_cap]  (value not drawn)
C40  1 uF  [GW_CAND_0603_cap]  (value not drawn)
C41  10 uF  [GW_CAND_0805_cap]  (value not drawn)
C42  100 nF  [GW_CAND_0603_cap]  (value not drawn)
C43  100 nF  [GW_CAND_0603_cap]  (value not drawn)
C44  100 nF  [GW_CAND_0603_cap]  (value not drawn)
C45  100 nF  [GW_CAND_0603_cap]  (value not drawn)
C46  C1206C102KGRACAUTO  [GW_C1206_KEMET_C1076_DENSITY_B]  (value not drawn)
C47  10 nF  [GW_CAND_0603_cap]  (value not drawn)
C48  100 nF  [GW_CAND_0603_cap]  (value not drawn)
C49  1 uF  [GW_CAND_0603_cap]  (value not drawn)
C50  10 uF  [GW_CAND_0805_cap]  (value not drawn)
C51  100 nF  [GW_CAND_0603_cap]  (value not drawn)
C52  C1206C102KGRACAUTO  [GW_C1206_KEMET_C1076_DENSITY_B]  (value not drawn)
C53  100 nF  [GW_CAND_0603_cap]  (value not drawn)
C54  100 nF  [GW_CAND_0603_cap]  (value not drawn)
D?  TPD4E05U06DQAR  [GW_DQA0010A_TI]
J2  SS-7188S-A-NF  [GW_SS7188SANF_STEWART]
R12  CRCW080575R0FKEA  [GW_CRCW0805_VISHAY_20035_REFLOW]  (value not drawn)
R13  6.49 kOhm  [GW_CAND_0603_res]  (value not drawn)
R14  CRCW080575R0FKEA  [GW_CRCW0805_VISHAY_20035_REFLOW]  (value not drawn)
R15  2.49 kOhm  [GW_CAND_0603_res]  (value not drawn)
R16  10 kOhm  [GW_CAND_0603_res]  (value not drawn)
R17  CRCW080575R0FKEA  [GW_CRCW0805_VISHAY_20035_REFLOW]  (value not drawn)
R18  10 kOhm  [GW_CAND_0603_res]  (value not drawn)
R19  CRCW080575R0FKEA  [GW_CRCW0805_VISHAY_20035_REFLOW]  (value not drawn)
T1  HX1188FNL  [GW_HX1188FNL_PULSE]
U5  DP83826IRHBR  [GW_RHB0032M_TI]  (value not drawn)
U6  THVD1420DR  [GW_SOIC8_1P27_5P4]  (value not drawn)
U7  ATA6561-GAQW  [GW_SOIC8_1P27_5P4]  (value not drawn)
Y2  KC2016Z25.0000C15XXK  [GW_KC2016Z_KYOCERA]

### Ports
CAN_STBY (in), ETH_MDC (in), ETH_MDIO (bidir), ETH_RMII_CRS_DV (out), ETH_RMII_REF_CLK (out), ETH_RMII_RXD0 (out), ETH_RMII_RXD1 (out), ETH_RMII_TX_EN (in), ETH_RMII_TXD0 (in), ETH_RMII_TXD1 (in), FDCAN1_RX (out), FDCAN1_TX (in), PHY_nRESET (in), RS485_DE (in), RS485_nRE (in), USART3_RX (out), USART3_TX (in)

### Nets
3.3V: C36.2 C38.1 C39.1 C40.1 C41.1 C47.1 C48.1 C49.1 C50.1 C51.1 C54.1 R15.1 R16.2 U5.3(VDDA3V3) U5.17(VDDIO) U6.8(VCC) U7.5(VIO) Y2.1(STANDBY) Y2.4(VCC)
5V: C53.1 U7.3(VCC)
GND: C36.1 C37.2 C38.2 C39.2 C40.2 C41.2 C42.2 C43.2 C44.2 C45.2 C46.1 C47.2 C48.2 C49.2 C50.2 C51.2 C52.1 C53.2 C54.2 D?.3(GND) D?.8(GND) R13.1 R18.1 U5.33(GND_EP) U6.5(GND) U7.2(GND) Y2.2(GND)
MDI_RXN: D?.5(D2-) T1.8(RD-) U5.4(RD_M)
MDI_RXP: D?.4(D2+) T1.6(RD+) U5.5(RD_P)
MDI_TXN: D?.2(D1-) T1.3(TD-) U5.6(TD_M)
MDI_TXP: D?.1(D1+) T1.1(TD+) U5.7(TD_P)
RX+: J2.3 T1.11(RX+)
RX-: J2.6 T1.9(RX-)
TX+: J2.1 T1.16(TX+)
TX-: J2.2 T1.14(TX-)
XI: U5.9(XI/50MHzIn) Y2.3(OUT_25MHz)
NetC37_1: C37.1 U5.2(CEXT)
NetC42_1: C42.1 C43.1 T1.2(TCT)
NetC44_1: C44.1 C45.1 T1.7(RCT)
NetC46_2: C46.2 R12.2 R14.2
NetC52_2: C52.2 R17.2 R19.1
NetJ2_4: J2.4 J2.5 R19.2
NetJ2_7: J2.7 J2.8 R17.1
NetR12_1: R12.1 T1.10(CMT_RX)
NetR13_2: R13.2 U5.10(RBIAS)
NetR14_1: R14.1 T1.15(CMT_TX)
NetR15_2: R15.2 U5.14(RX_D2)
NetR16_1: R16.1 U6.2(/RE) ; port RS485_nRE
NetR18_2: R18.2 U6.3(DE) ; port RS485_DE
NetU4_5: U5.32(RST_N) ; port PHY_nRESET
NetU4_16: U5.12(MDC) ; port ETH_MDC
NetU4_23: U5.19(RX_CLK/50MHz_RMII) ; port ETH_RMII_REF_CLK
NetU4_24: U5.11(MDIO) ; port ETH_MDIO
NetU4_31: U5.18(RX_DV/CRS_DV) ; port ETH_RMII_CRS_DV
NetU4_32: U5.16(RX_D0) ; port ETH_RMII_RXD0
NetU4_33: U5.15(RX_D1) ; port ETH_RMII_RXD1
NetU4_37: U7.8(STBY) ; port CAN_STBY
NetU4_47: U5.23(TX_EN) ; port ETH_RMII_TX_EN
NetU4_51: U5.24(TX_D0) ; port ETH_RMII_TXD0
NetU4_52: U5.25(TX_D1) ; port ETH_RMII_TXD1
NetU4_55: U6.4(D) ; port USART3_TX
NetU4_56: U6.1(R) ; port USART3_RX
NetU4_81: U7.4(RXD) ; port FDCAN1_RX
NetU4_82: U7.1(TXD) ; port FDCAN1_TX

Not connected (* = marked no-connect by the designer): D? 6(NC)* 7(NC)* 9(NC)* 10(NC)*; J2 S1(SHIELD1)* S2(SHIELD2)*; T1 4(NC)* 5(NC)* 12(NC)* 13(NC)*; U5 1(ModeSelect)* 8(XO)* 13(RX_D3)* 20(RX_ER)* 21(PWRDN/INT)* 22(TX_CLK)* 26(TX_D2)* 27(TX_D3)* 28(COL/LED2/TX_ER/GPIO)* 29(CRS/LED3)* 30(LED0)* 31(CLKOUT/LED1)*; U6 6(A) 7(B); U7 6(CANL) 7(CANH)

### Library data of the parts
C36 C38 C47 = GW_C0603C103K1RACTU_97f3ee33: as C3 on sheet Power; Manufacturer Part Number: C0603C103K1RACTU; Value: 10 nF; Rating: 100 V; X7R; -55..125 C; Power Rating: N/A; Package: 0603; CAD_Status: CAD_CANDIDATE
C37 = GW_C0603C202J5GACTU_fa733a70: C0603C202J5GACTU; 2 nF; 50 V; C0G; CAD_CANDIDATE; Manufacturer: KEMET; Tolerance: 5% seleccion; Electrical_Status: PROVISIONAL; CAD_Source: Professor_shared.SchLib glyph Cap_0.1uF_0603_50V; CAD_Limitations: Glyph pins/types inspected; exact manufacturer land-pattern/mask/paste qualification pending.; Electrical_Notes: Conflicto EVM C57=100 nF; prevalece requisito actual 2 nF, no copiar C57. Modelo candidato existente; sin cotejo visual de pads/pines en Altium.; Manufacturer Part Number: C0603C202J5GACTU; Value: 2 nF; Rating: 50 V; C0G; Power Rating: N/A; Package: 0603; CAD_Status: CAD_CANDIDATE
C39 C42-C45 C48 C51 C53 C54 = GW_C0603C104K5RACTU_dc5e12a5: as C10 on sheet Power; Manufacturer Part Number: C0603C104K5RACTU; Value: 100 nF; Rating: 50 V; X7R; -55..125 C; Power Rating: N/A; Package: 0603; CAD_Status: CAD_CANDIDATE
C40 C49 = GW_CL10A105KB8NNNC_c3932faa: as C12 on sheet Power; Manufacturer Part Number: CL10A105KB8NNNC; Value: 1 uF; Rating: 50 V; X5R; -55..85 C; Power Rating: N/A; Package: 0603; CAD_Status: CAD_CANDIDATE
C41 C50 = GW_CL21A106KAYNNNE_c6e24382: CL21A106KAYNNNE; 10 uF; 25 V; X5R; -55..85 C; CAD_CANDIDATE; Manufacturer: Samsung Electro-Mechanics; Tolerance: 10%; Electrical_Status: PROVISIONAL; CAD_Source: Professor_shared.SchLib glyph Cap_10uF_0805_25V_; CAD_Limitations: Glyph pins/types inspected; exact manufacturer land-pattern/mask/paste qualification pending.; Electrical_Notes: Ceff a 3.3 V y temperatura pendientes. No usar para entrada 30 V. Modelo candidato existente; sin cotejo visual de pads/pines en Altium.; Manufacturer Part Number: CL21A106KAYNNNE; Value: 10 uF; Rating: 25 V; X5R; -55..85 C; Power Rating: N/A; Package: 0805; CAD_Status: CAD_CANDIDATE
C46 C52 = C1206C102KGRACAUTO: KEMET1nF10%2kVDCX7R1206; Ethernet chassis AC return; no safety-Y or surge claim; Manufacturer: KEMET; Value: 1 nF; Tolerance: 10%; Voltage Rating: 2000 VDC; Dielectric: X7R; CAD Status: CAD_VERIFIED; Electrical Approval: PROVISIONAL_APPLICATION; not safety-Y certified; Electrical Test: NOT_TESTED; Assembly: JLC Extended observed2026-11-07; quantity unknown; no stock reservation; Manufacturer Part Number: C1206C102KGRACAUTO; Package: 1206 /3216; Datasheet: sources/ethernet_1nf/C600002.pdf; Source: KEMET C1076_X7R_HV_AUTO_SMD9/10/2019 pp1-2 ordering/rating,p4 body,p10 Table3 densityB1206; C600002 exact catalog identity; LCSC Part Number: C600002; Terminal Mapping: Nonpolar, project1-left/2-right; symbol1->pad1,2->pad2
D? = TPD4E05U06DQAR: TI SLVSBO7O table4-2 p4; DQA0010A 4220328/A board/stencil pp29-30; PHY-side only, per DP83826EVM sheet3. GND3/8 to logic GND. NC6/7/9/10 may be pass-through pads; preserve isolation.; Manufacturer: Texas Instruments; CAD Status: CAD_CANDIDATE; Manufacturer Part Number: TPD4E05U06DQAR; Source: TI SLVSBO7O table4-2 p4; DQA0010A 4220328/A board/stencil pp29-30; Limitations: PHY-side only, per DP83826EVM sheet3. GND3/8 to logic GND. NC6/7/9/10 may be pass-through pads; preserve isolation.
J2 = SS-7188S-A-NF: Cinch/Stewart CT710001 revB0 10-Jul-2023 component-side recommended hole layout; Numbered contacts per component-side drawing. S1/S2 are project labels for unnumbered shield tabs; MP1/2 are non-electrical mounting holes. Candidate copper lands; sourcing risk separate.; CAD Status: CAD_CANDIDATE; Manufacturer: Cinch / Stewart; Manufacturer Part Number: SS-7188S-A-NF; Source: Cinch/Stewart CT710001 revB0 10-Jul-2023 component-side recommended hole layout; Limitations: Numbered contacts per component-side drawing. S1/S2 are project labels for unnumbered shield tabs; MP1/2 are non-electrical mounting holes. Candidate copper lands; sourcing risk separate.
R12 R14 R17 R19 = CRCW080575R0FKEA: 75Ohm1%0.125W0805 Vishay D/CRCW e3; Ethernet cable termination; not C-suffix commodity variant; Value: 75 Ohm; Tolerance: 1%; Power Rating: 0.125 W at70C; derating applies; TCR: 100 ppm/K; Local Datasheet: sources/ethernet_75ohm/C844859.pdf; CAD Status: CAD_VERIFIED; Design Approval: RETAINED_ORIGINAL_SELECTION; Electrical Test: NOT_TESTED; Assembly: JLC Extended observed; quantity unknown; verify before ordering; Manufacturer: Vishay; Manufacturer Part Number: CRCW080575R0FKEA; Package: 0805 /2012; Datasheet: https://www.vishay.com/docs/20035/dcrcwe3.pdf; Source: Vishay20035 Rev18-Jun-2018 p3 ordering, p9 body/reflow lands; JLC C844859 exact identity observed2026-11-07; LCSC Part Number: C844859; Terminal Mapping: Nonpolar resistor: project pin1=left pad1,pin2=right pad2
R13 = GW_RC0603FR-076K49L_f42a9329: RC0603FR-076K49L; 6.49 kOhm; 75 V max; limite sqrt(P*R); CAD_CANDIDATE; Manufacturer: Yageo; Tolerance: 1%; Power Rating: 0.1 W @70 C; Electrical_Status: PROVISIONAL; CAD_Source: Professor_shared.SchLib glyph Res_10k_0603_1/10W; CAD_Limitations: Glyph pins/types inspected; exact manufacturer land-pattern/mask/paste qualification pending.; Electrical_Notes: P<3.3^2/6490=1.68 mW; actualizacion de valor/MPN sobre simbolo generico pendiente. Modelo candidato existente; sin cotejo visual de pads/pines en Altium.; Manufacturer Part Number: RC0603FR-076K49L; Value: 6.49 kOhm; Rating: 75 V max; limite sqrt(P*R); Package: 0603; CAD_Status: CAD_CANDIDATE
R15 = GW_RC0603FR-072K49L_b905c5f0: RC0603FR-072K49L; 2.49 kOhm; 75 V max; limite sqrt(P*R); CAD_CANDIDATE; Manufacturer: Yageo; Tolerance: 1%; Power Rating: 0.1 W @70 C; Electrical_Status: PROVISIONAL; CAD_Source: Professor_shared.SchLib glyph Res_10k_0603_1/10W; CAD_Limitations: Glyph pins/types inspected; exact manufacturer land-pattern/mask/paste qualification pending.; Electrical_Notes: Candidato ENHANCED/RMII leader: ModeSelect NC, strap1=1 default, strap8=1, strap5=0 default. Ver tabla del informe; sin LEDs de straps. Modelo candidato existente; sin cotejo visual de pads/pines en Altium.; Manufacturer Part Number: RC0603FR-072K49L; Value: 2.49 kOhm; Rating: 75 V max; limite sqrt(P*R); Package: 0603; CAD_Status: CAD_CANDIDATE
R16 R18 = GW_FRC0603J103TS_7289f91d: as R11 on sheet MCU; Manufacturer Part Number: FRC0603J103TS; Value: 10 kOhm; Rating: >= 3.3 V; tension de trabajo por verificar; Package: 0603; CAD_Status: CAD_CANDIDATE
T1 = HX1188FNL: Pulse HX1188FNL revB 30-May-2014 sheets2-3 PS-2005.002-D; Use exact winding map; NC4,5,12,13 remain unconnected. FNLT is packaging variant; selected MPN FNL.; Manufacturer: Pulse Electronics; CAD Status: CAD_CANDIDATE; Manufacturer Part Number: HX1188FNL; Source: Pulse HX1188FNL revB 30-May-2014 sheets2-3 PS-2005.002-D; Limitations: Use exact winding map; NC4,5,12,13 remain unconnected. FNLT is packaging variant; selected MPN FNL.
U5 = DP83826IRHBR: DP83826IRHBR; CAD_CANDIDATE; Multi-function strap pins conservatively bidirectional. Mode not frozen. EP33 must be soldered to ground; thermal vias are board-level optional, filled/plugged/tented if under paste.; Manufacturer: Texas Instruments; Electrical_Status: PROVISIONAL; CAD_Source: SNLS647I table5-1 pp5-6; exposed pad p7; RHB0032M 4223725/A PDF pp111-113; Manufacturer Part Number: DP83826IRHBR; Value: DP83826IRHBR; CAD_Status: CAD_CANDIDATE; CAD_Limitations: Multi-function strap pins conservatively bidirectional. Mode not frozen. EP33 must be soldered to ground; thermal vias are board-level optional, filled/plugged/tented if under paste.
U6 = THVD1420DR: THVD1420DR; CAD_CANDIDATE;; Manufacturer: Texas Instruments; Electrical_Status: PROVISIONAL; CAD_Source: SLLSF78B table4-1 p3; D0008A 4214825/C PDF pp30-32; CAD_Limitations: Circuit not electrically released.; Manufacturer Part Number: THVD1420DR; Value: THVD1420DR; CAD_Status: CAD_CANDIDATE
U7 = ATA6561-GAQW: ATA6561-GAQW; CAD_CANDIDATE;; Manufacturer: Microchip; Electrical_Status: PROVISIONAL; CAD_Source: DS20005991B pin table p3; C04-2057-OA RevE p19; CAD_Limitations: Circuit not electrically released.; Manufacturer Part Number: ATA6561-GAQW; Value: ATA6561-GAQW; CAD_Status: CAD_CANDIDATE
Y2 = KC2016Z25.0000C15XXK: as Y1 on sheet MCU; Manufacturer: Kyocera; Manufacturer Part Number: KC2016Z25.0000C15XXK; Source: Kyocera TNY1T-H1-DEX01-11 17-Jul-2026 pp4,6 table2 fig4; Limitations: Two independent oscillators proposed; 10nF per supply. Tie1 to3V3. Load<=15pF and PHY phase-noise qualification pending.

## Sheet TopLevel.SchDoc
size A
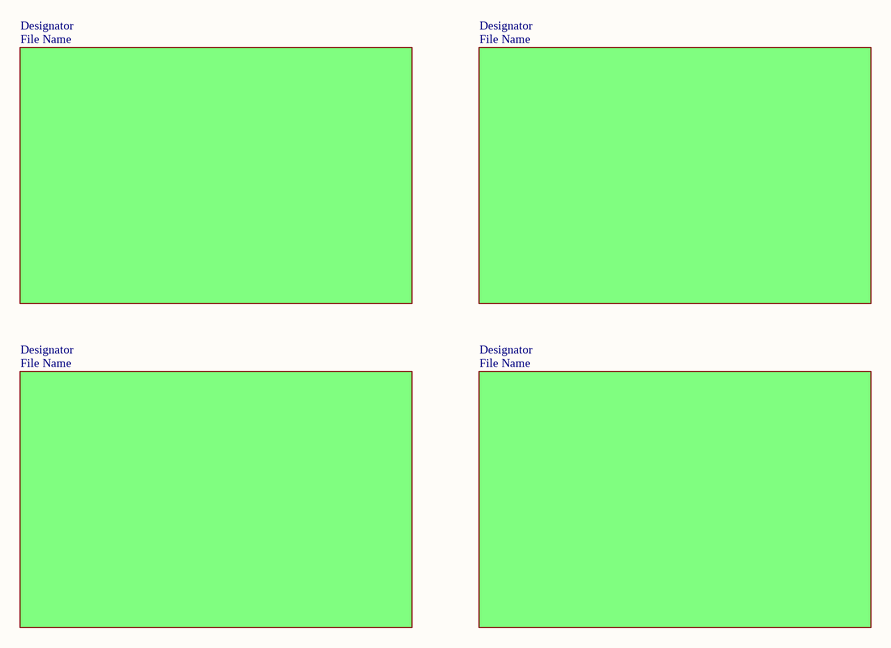
[diagram p3: TopLevel.SchDoc]

### Sub-sheets
Designator = File Name (file not in this document): no entries
Designator = File Name (file not in this document): no entries
Designator = File Name (file not in this document): no entries
Designator = File Name (file not in this document): no entries

## Sheet Field_IO.SchDoc
size A4
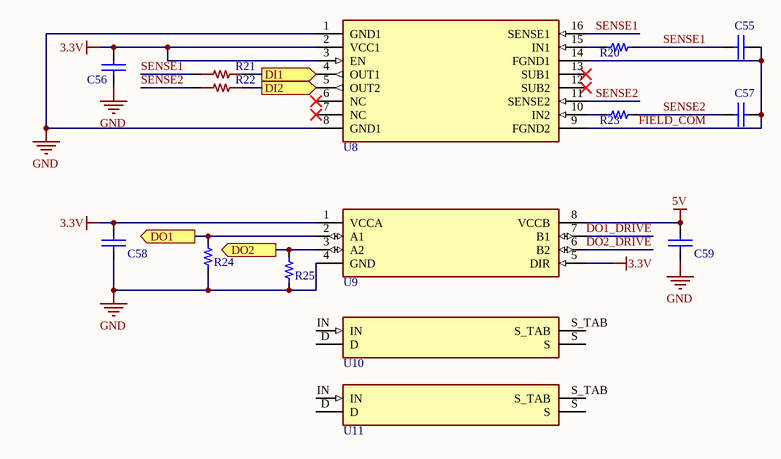
[diagram p4: Field_IO.SchDoc]

### Parts
C55  10 nF  [GW_CAND_0603_cap]  (value not drawn)
C56  100 nF  [GW_CAND_0603_cap]  (value not drawn)
C57  10 nF  [GW_CAND_0603_cap]  (value not drawn)
C58  100 nF  [GW_CAND_0603_cap]  (value not drawn)
C59  100 nF  [GW_CAND_0603_cap]  (value not drawn)
R20  562 Ohm  [GW_CAND_0603_res]  (value not drawn)
R21  MM204F1K00TKRTR3K0  [GW_MM204_FIRSTOHM]  (value not drawn)
R22  MM204F1K00TKRTR3K0  [GW_MM204_FIRSTOHM]  (value not drawn)
R23  562 Ohm  [GW_CAND_0603_res]  (value not drawn)
R24  10 kOhm  [GW_CAND_0603_res]  (value not drawn)
R25  10 kOhm  [GW_CAND_0603_res]  (value not drawn)
U8  ISO1212DBQR  [GW_DBQ0016A_TI]  (value not drawn)
U9  SN74LVC2T45DCTR  [GW_DCT0008A_TI]  (value not drawn)
U10  BSP75NTA  [GW_BSP75N_SOT223_DN_DIODES]  (value not drawn)
U11  BSP75NTA  [GW_BSP75N_SOT223_DN_DIODES]  (value not drawn)

### Ports
DI1 (out), DI2 (out), DO1 (out), DO2 (out)

### Nets
3.3V: C56.1 C58.1 U8.2(VCC1) U8.3(EN) U9.1(VCCA) U9.5(DIR)
5V: C59.1 U9.8(VCCB)
GND: C56.2 C58.2 C59.2 R24.1 R25.1 U8.1(GND1) U8.8(GND1) U9.4(GND)
DO1_DRIVE: U9.7(B1)
DO2_DRIVE: U9.6(B2)
FIELD_COM: C55.2 C57.2 U8.9(FGND2) U8.14(FGND1)
SENSE1: C55.1 R20.2 R21.1 U8.16(SENSE1)
SENSE2: C57.1 R22.1 R23.2 U8.11(SENSE2)
NetR20_1: R20.1 U8.15(IN1)
NetR21_2: R21.2 U8.4(OUT1) ; port DI1
NetR22_2: R22.2 U8.5(OUT2) ; port DI2
NetR23_1: R23.1 U8.10(IN2)
NetR24_2: R24.2 U9.2(A1) ; port DO1
NetR25_2: R25.2 U9.3(A2) ; port DO2

Not connected (* = marked no-connect by the designer): U8 6(NC)* 7(NC)* 12(SUB2)* 13(SUB1)*; U10 D IN S S_TAB; U11 D IN S S_TAB

### Library data of the parts
C55 C57 = GW_C0603C103K1RACTU_97f3ee33: as C3 on sheet Power; Manufacturer Part Number: C0603C103K1RACTU; Value: 10 nF; Rating: 100 V; X7R; -55..125 C; Power Rating: N/A; Package: 0603; CAD_Status: CAD_CANDIDATE
C56 C58 C59 = GW_C0603C104K5RACTU_dc5e12a5: as C10 on sheet Power; Manufacturer Part Number: C0603C104K5RACTU; Value: 100 nF; Rating: 50 V; X7R; -55..125 C; Power Rating: N/A; Package: 0603; CAD_Status: CAD_CANDIDATE
R20 R23 = GW_RC0603FR-07562RL_a6fad8df: RC0603FR-07562RL; 562 Ohm; 75 V max; limite sqrt(P*R); CAD_CANDIDATE; Manufacturer: Yageo; Tolerance: 1%; Power Rating: 0.1 W @70 C; Electrical_Status: PROVISIONAL; CAD_Source: Professor_shared.SchLib glyph Res_10k_0603_1/10W; CAD_Limitations: Glyph pins/types inspected; exact manufacturer land-pattern/mask/paste qualification pending.; Electrical_Notes: Ityp2.25mA; P conservadora a2.75mA=4.30mW. No es resistor de24V completos; corriente de campo separada deVCC1. Modelo candidato existente; sin cotejo visual de pads/pines en Altium.; Manufacturer Part Number: RC0603FR-07562RL; Value: 562 Ohm; Rating: 75 V max; limite sqrt(P*R); Package: 0603; CAD_Status: CAD_CANDIDATE
R21 R22 = MM204F1K00TKRTR3K0: Firstohm MM rev08-March-2023 printedpp75-78; p78 reflow pad table MM16/MM204; 1kOhm1%,0.25W@70C; normal Type3 operation supported. 500V/1kV system surge withstand NOT established.; CAD Status: CAD_CANDIDATE; Manufacturer: Firstohm; Manufacturer Part Number: MM204F1K00TKRTR3K0; Source: Firstohm MM rev08-March-2023 printedpp75-78; p78 reflow pad table MM16/MM204; Limitations: 1kOhm1%,0.25W@70C; normal Type3 operation supported. 500V/1kV system surge withstand NOT established.
R24 R25 = GW_FRC0603J103TS_7289f91d: as R11 on sheet MCU; Manufacturer Part Number: FRC0603J103TS; Value: 10 kOhm; Rating: >= 3.3 V; tension de trabajo por verificar; Package: 0603; CAD_Status: CAD_CANDIDATE
U8 = ISO1212DBQR: ISO1212DBQR; CAD_CANDIDATE; SUB12 and SUB13 must remain separate floating nets. TI recommends an individual 2x2mm floating copper island for each; these board-level islands are NOT encoded in this package footprint. Never join to either FGND, GND1 or each; Manufacturer: Texas Instruments; Electrical_Status: PROVISIONAL; CAD_Source: SLLSEY7G table4-2 p4; DBQ0016A 4214846/A PDF pp44-46; CAD_Limitations: SUB12 and SUB13 must remain separate floating nets. TI recommends an individual 2x2mm floating copper island for each; these board-level islands are NOT encoded in this package footprint. Never join to either FGND, GND1 or each other. NC6/7 unconnected.; Manufacturer Part Number: ISO1212DBQR; Value: ISO1212DBQR; CAD_Status: CAD_CANDIDATE
U9 = SN74LVC2T45DCTR: SN74LVC2T45DCTR; CAD_CANDIDATE; Electrical candidate only; no OE pin. VOH at BSP75N input load remains open.; Manufacturer: Texas Instruments; Electrical_Status: PROVISIONAL; CAD_Source: SCES516N table4-1 p2; DCT0008A 4220784/D PDF pp28-30; Manufacturer Part Number: SN74LVC2T45DCTR; Value: SN74LVC2T45DCTR; CAD_Status: CAD_CANDIDATE; CAD_Limitations: Electrical candidate only; no OE pin. VOH at BSP75N input load remains open.
U10 U11 = BSP75NTA: BSP75NTA smart low-side switch; physical terminal positions and Diodes land pattern verified; IN,D,S,S_TAB identifiers; driver VOH acceptance remains pending.; Manufacturer: Diodes Incorporated; CAD_Status: CAD_BLOCKED; Electrical_Status: PROVISIONAL; CAD_Source: Diodes DS33016 Rev7-2 pp1,8; terminal numbering absent; CAD_Limitations: CAD_BLOCKED: terminal identifiers are role names, not manufacturer numbers. Tab=Source, isolated from Drain. Need exact numbered Type DN drawing/model before any placement or footprint binding.; CAD Status: CAD_VERIFIED; Limitations: Physical mapping verified from Diodes top view: with tab above, left IN, middle D, right S; tab S_TAB=Source. No manufacturer numeric pin IDs asserted. Loaded driver VOH and startup OFF not yet verified.; Electrical Approval: ELECTRICAL_BLOCKED_DRIVER_VOLTAGE_PENDING; Physical Mapping: IN left lower;D center lower;S right lower;S_TAB upper tab;Top View; Manufacturer Part Number: BSP75NTA; Value: BSP75NTA; Source: Diodes DS33016 Rev7-2 Jan2024 p1 Top View Pin Out, p8 Suggested Pad Layout; functional pad identifiers preserve original symbol pins; Datasheet: sources/bsp75n_closure/BSP75N.pdf

## Nets that join several sheets
3.3V: Power (6 pins), MCU (22 pins), Ethernet (19 pins), Field_IO (6 pins)
5V: Power (6 pins), Ethernet (C53.1 U7.3), Field_IO (C59.1 U9.8)
GND: Power (29 pins), MCU (24 pins), Ethernet (27 pins), Field_IO (8 pins)
NetR16_1: MCU (U4.58), Ethernet (R16.1 U6.2)
NetR18_2: MCU (U4.57), Ethernet (R18.2 U6.3)
NetR21_2: MCU (U4.3), Field_IO (R21.2 U8.4)
NetR22_2: MCU (U4.4), Field_IO (R22.2 U8.5)
NetR24_2: MCU (U4.1), Field_IO (R24.2 U9.2)
NetR25_2: MCU (U4.2), Field_IO (R25.2 U9.3)
NetU4_5: MCU (U4.5), Ethernet (U5.32)
NetU4_16: MCU (U4.16), Ethernet (U5.12)
NetU4_23: MCU (U4.23), Ethernet (U5.19)
NetU4_24: MCU (U4.24), Ethernet (U5.11)
NetU4_31: MCU (U4.31), Ethernet (U5.18)
NetU4_32: MCU (U4.32), Ethernet (U5.16)
NetU4_33: MCU (U4.33), Ethernet (U5.15)
NetU4_37: MCU (U4.37), Ethernet (U7.8)
NetU4_47: MCU (U4.47), Ethernet (U5.23)
NetU4_51: MCU (U4.51), Ethernet (U5.24)
NetU4_52: MCU (U4.52), Ethernet (U5.25)
NetU4_55: MCU (U4.55), Ethernet (U6.4)
NetU4_56: MCU (U4.56), Ethernet (U6.1)
NetU4_81: MCU (U4.81), Ethernet (U7.4)
NetU4_82: MCU (U4.82), Ethernet (U7.1)